# Altium schematic sheet STPMotorControl3_1.SchDoc
size A4; SheetNumber: 4; SheetTotal: 6
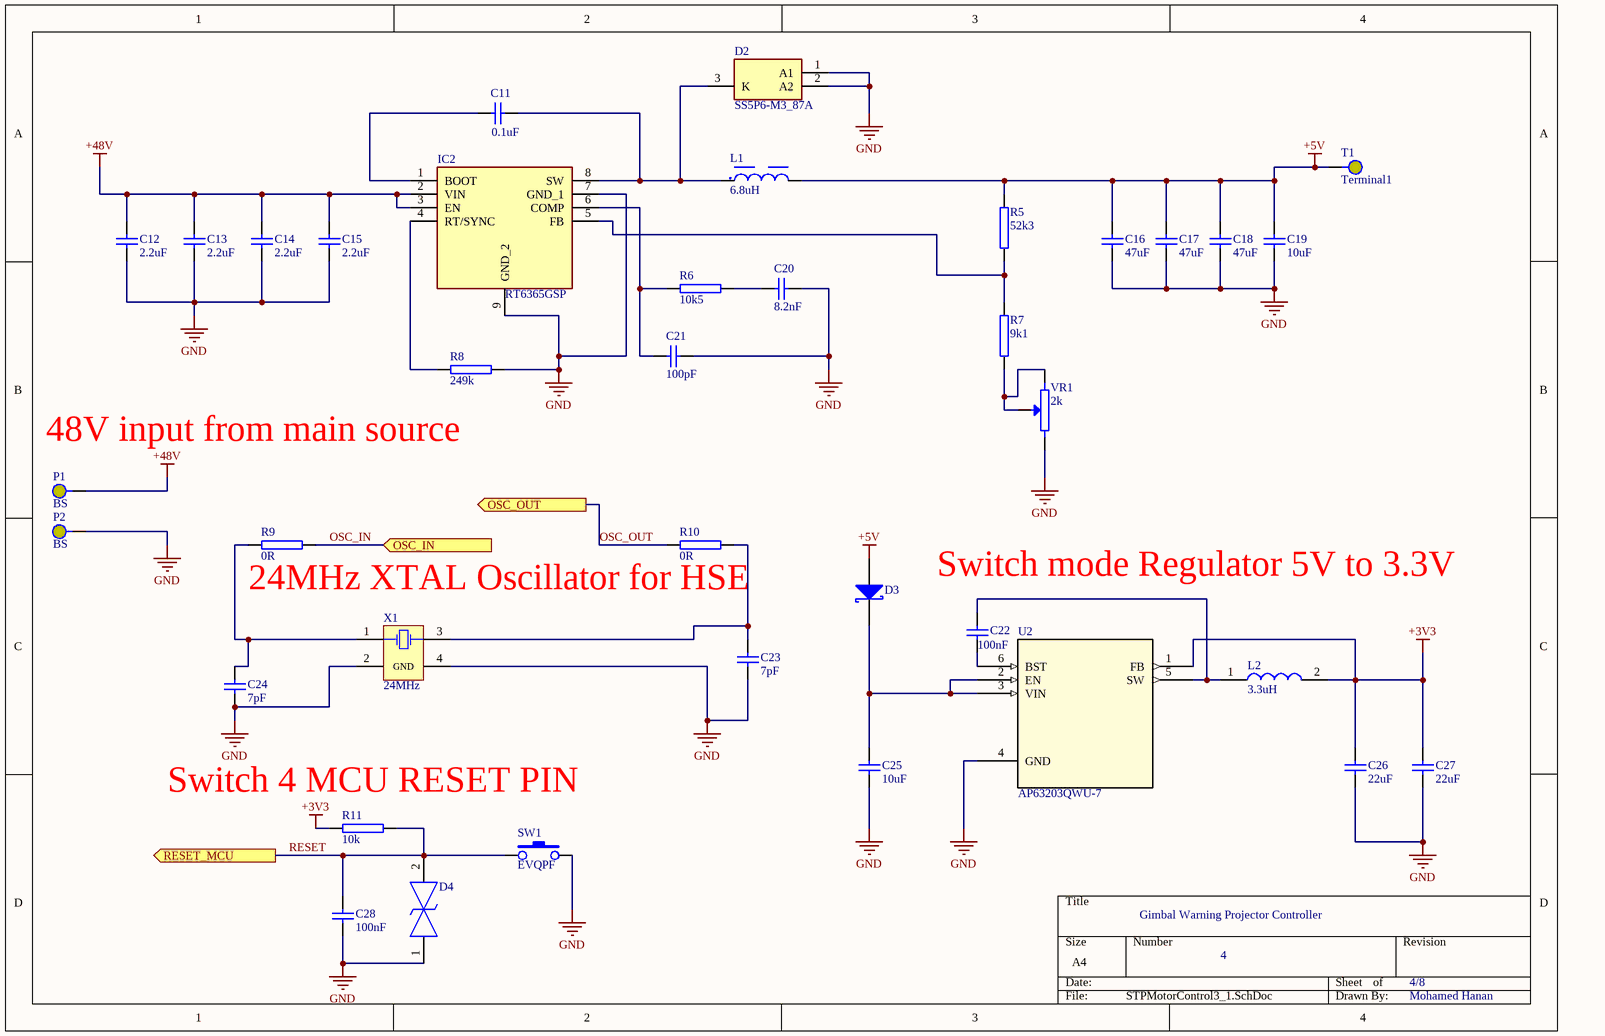
[diagram p0: STPMotorControl3_1.SchDoc]

## Parts
C11  0.1uF  [CAP_1206]
C12  2.2uF  [CAP_0805]
C13  2.2uF  [CAP_0805]
C14  2.2uF  [CAP_0805]
C15  2.2uF  [CAP_0805]
C16  47uF  [CAP_1206]
C17  47uF  [CAP_1206]
C18  47uF  [CAP_1206]
C19  10uF  [CAP_1206]
C20  8.2nF  [CAP_1206]
C21  100pF  [CAP_0805]
C22  100nF  [CAP_0805]
C23  7pF  [CAP_0805]
C24  7pF  [CAP_0805]
C25  10uF  [CAP_1206]
C26  22uF  [CAP_1206]
C27  22uF  [CAP_1206]
C28  100nF  [CAP_0805]
D2  SS5P6-M3_87A  [SS5P6M387A]
D3  PMEG3050BEP  [SOD-128]  (value not drawn)
D4  TSD05CDYFR  [SOD2613X100N]  (value not drawn)
IC2  RT6365GSP  [SOIC127P600X175-9N]
L1  6.8uH  [WE-LHMI_7050]
L2  3.3uH  [SRP4020TA3R3M]
P1  BS  [Banana_AUT]
P2  BS  [Banana_AUT]
R5  52k3  [RES_0805]
R6  10k5  [RES_0805]
R7  9k1  [RES_0805]
R8  249k  [RES_1206]
R9  0R  [RES_0805]
R10  0R  [RES_0805]
R11  10k  [RES_0805]
SW1  EVQPF  [EVQPF203M]
T1  Terminal1  [PAD1_AUT]
U2  AP63203QWU-7  [TSOT26_DIO]
VR1  2k  [3362S]
X1  24MHz  [CX2520SB]

## Ports
OSC_IN (in, see STPMotorConnections[3B], STPMotorControl_1[1B]), OSC_OUT (out, see STPMotorConnections[3B], STPMotorControl_1[1B]), RESET_MCU (out, see STPMotorConnections[3B], STPMotorControl_1[1B])

## Nets
+3V3: C26.2 C27.2 L2.2 R11.2 U2.1(FB)
+5V: C16.2 C17.2 C18.2 C19.2 D3.A L1.2 R5.2 T1.1
+48V: C12.2 C13.2 C14.2 C15.2 IC2.2(VIN) IC2.3(EN) P1.1
GND: C12.1 C13.1 C14.1 C15.1 C16.1 C17.1 C18.1 C19.1 C20.2 C21.2 C23.2 C24.2 C25.1 C26.1 C27.1 C28.1 D2.1(A1) D2.2(A2) D4.1 IC2.7(GND_1) IC2.9(GND_2) P2.1 R8.2 SW1.2 U2.4(GND) VR1.2(BOT) X1.2(GND) X1.4(GND)
OSC_IN: R9.2 ; port OSC_IN
OSC_OUT: R10.1 ; port OSC_OUT
RESET: C28.2 D4.2 R11.1 SW1.1 ; port RESET_MCU
NetC11_1: C11.1 IC2.1(BOOT)
NetC11_2: C11.2 D2.3(K) IC2.8(SW) L1.1
NetC20_1: C20.1 R6.2
NetC21_1: C21.1 IC2.6(COMP) R6.1
NetC22_1: C22.1 U2.6(BST)
NetC22_2: C22.2 L2.1 U2.5(SW)
NetC23_1: C23.1 R10.2 X1.3(OSC2)
NetC24_1: C24.1 R9.1 X1.1(OSC1)
NetC25_2: C25.2 D3.K U2.2(EN) U2.3(VIN)
NetIC2_4: IC2.4(RT/SYNC) R8.1
NetIC2_5: IC2.5(FB) R5.1 R7.2
NetR7_1: R7.1 VR1.1(TOP) VR1.W(TAP)

## Notes on the sheet
- 48V input from main source
- (near C22) Switch mode Regulator 5V to 3.3V
- 24MHz XTAL Oscillator for HSE
- (near R11) Switch 4 MCU RESET PIN
- Gimbal Warning Projector Controller
- 4
- 4/8
- Mohamed Hanan

## Library data of the parts
C11 C16-C20 C25-C27 = CAPN 1206: Non Polarized Capacitor, SMD, 1206
C12-C15 C21-C24 C28 = CAPN 0805: Non Polarized Capacitor, SMD, 0805
D2 = SS5P6-M3_87A: Schottky Diode; Manufacturer_Name: Vishay; Manufacturer_Part_Number: SS5P6-M3/87A; Datasheet Link: https://www.vishay.com/docs/88988/ss5p6.pdf; Height: 1.2mm; Mouser Part Number: 625-SS5P6-M3/87A; Mouser Price/Stock: https://www.mouser.co.uk/ProductDetail/Vishay-General-Semiconductor/SS5P6-M3-87A?qs=XGzIaZb%2FFYLx0h%2FWoI%2FVUQ%3D%3D; Arrow Part Number: SS5P6-M3/87A; Arrow Price/Stock: https://www.arrow.com/en/products/ss5p6-m387a/vishay?utm_currency=USD&region=nac
D3 = PMEG3050BEP: Schottky REC, 30V, 5A, SMD; Supplier 1: Farnell; Supplier Part Number 1: 1829196
D4 = TSD05CDYFR: TVS Diode (Bi-directional); Manufacturer_Name: Texas Instruments; Datasheet Link: https://www.ti.com/lit/ds/symlink/tsd05c.pdf?ts=1691730725852&ref_url=https%253A%252F%252Fwww.ti.com%252Fproduct%252FTSD05C%253FkeyMatch%253DTSD05CDYFR%2526tisearch%253Dsearch-everything%2526usecase%253DOPN; Height: 1mm; Manufacturer_Part_Number: TSD05CDYFR; Mouser Part Number: 595-TSD05CDYFR; Mouser Price/Stock: https://www.mouser.co.uk/ProductDetail/Texas-Instruments/TSD05CDYFR?qs=Imq1NPwxi74wAiGFX0POZQ%3D%3D; Arrow Part Number: TSD05CDYFR; Arrow Price/Stock: https://www.arrow.com/en/products/tsd05cdyfr/texas-instruments.html?utm_currency=USD&region=nac
IC2 = RT6365GSP: Integrated Circuit; Manufacturer_Name: RICHTEK; Datasheet Link: https://www.richtek.com/assets/product_file/RT6365/DS6365-02.pdf; Height: 1.753mm; Manufacturer_Part_Number: RT6365GSP; Mouser Part Number: 835-RT6365GSP; Mouser Price/Stock: https://www.mouser.co.uk/ProductDetail/Richtek/RT6365GSP?qs=amGC7iS6iy%252BGHkAL3RFUug%3D%3D
L1 = WE-LHMI_7050: Power Inductor, 6.8Uh, Shielded, 6.6A Rohs Compliant: Yes |Wurth Elektronik 7443734948068; MF: Wurth Electronics; SnapEDA_Link: https://www.snapeda.com/parts/7443734948068/Wurth+Electronics/view-part/?ref=snap; Package: None; Value: *; MP: 7443734948068; Check_prices: https://www.snapeda.com/parts/7443734948068/Wurth+Electronics/view-part/?ref=eda
L2 = SRP4020TA-3R3M: Inductor; Manufacturer_Name: Bourns; Datasheet Link: https://www.bourns.com/docs/Product-Datasheets/SRP4020TA.pdf; Height: 2mm; Manufacturer_Part_Number: SRP4020TA-3R3M; Mouser Part Number: 652-SRP4020TA-3R3M; Mouser Price/Stock: https://www.mouser.co.uk/ProductDetail/Bourns/SRP4020TA-3R3M?qs=Ph8%2FHnX6CQx4K7XcRwo6CA%3D%3D; Arrow Part Number: SRP4020TA-3R3M; Arrow Price/Stock: https://www.arrow.com/en/products/srp4020ta-3r3m/bourns?region=nac
P1 P2 = Banana Socket: Banana Socket, 4mm, Panel, Black, 10A; Supplier 1: Farnell; Supplier Part Number 1: 1101113
R5-R7 R9-R11 = Resistor 0805: Resistor, SMD, 0805
R8 = Resistor 1206: Resistor, SMD, 1206
SW1 = EVQPF: PANASONIC  EVQPF203M  SWITCH, TACTILE, SPST-NO, 20mA, 15VDC; Supplier 1: Farnell; Supplier Part Number 1: 2079505
T1 = Terminal1: Terminal, Pad 70x70mil, Hole 32 mil
U2 = AP63203QWU-7: Description; Manufacturer_Name: Diodes Inc; Type: Power Management; Copyright: Copyright (C) 2026 Ultra Librarian. All rights reserved.; Manufacturer_Part_Number: AP63203QWU-7; RefDes: RefDes
VR1 = 3362S-1-202LF: 3362S Series, 1/4 ” Square  Potentiometer, 2k, 10%, 0.5 Watts, 1Turn; Supplier 1: Farnell; Supplier Part Number 1: 2321842
X1 = CX2520SB24000D0FLJZZ: Crystals, 24MHz; Supplier 1: Farnell; Supplier Part Number 1: 1657889